# Altium schematic sheet NFC_READER.SchDoc
size 330 x 220 mm; SheetNumber: 1; SheetTotal: 1
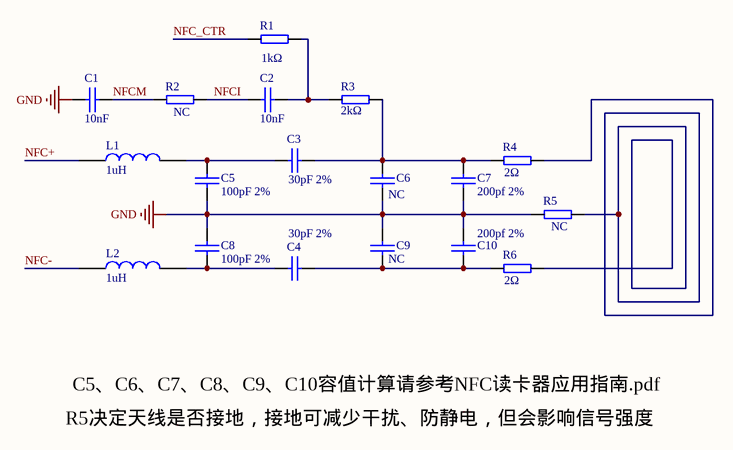
[diagram p0: NFC_READER.SchDoc]

## Parts
C1  10nF  [0402_C]
C2  10nF  [0402_C]
C3  30pF 2%  [0402_C]
C4  30pF 2%  [0402_C]
C5  100pF 2%  [0402_C]
C6  NC  [0402_C]
C7  200pf 2%  [0402_C]
C8  100pF 2%  [0402_C]
C9  NC  [0402_C]
C10  200pf 2%  [0402_C]
L1  1uH  [0603]
L2  1uH  [0603]
R1  1kΩ  [0402]
R2  NC  [0402]
R3  2kΩ  [0402]
R4  2Ω  [0402]
R5  NC  [0402]
R6  2Ω  [0402]

## Nets
GND: C1.2 C5.1 C6.1 C7.1 C8.2 C9.2 C10.2 R5.2
NFC+: L1.1
NFC-: L2.1
NFC_CTR: R1.2
NFCI: C2.1 R2.1
NFCM: C1.1 R2.2
NetC2_2: C2.2 R1.1 R3.2
NetC3_1: C3.1 C5.2 L1.2
NetC3_2: C3.2 C6.2 C7.2 R3.1 R4.1
NetC4_1: C4.1 C8.1 L2.2
NetC4_2: C4.2 C9.1 C10.1 R6.1
NetR4_2: R4.2 R5.1 R6.2

## Notes on the sheet
- R5决定天线是否接地，接地可减少干扰、防静电，但会影响信号强度
- C5、C6、C7、C8、C9、C10容值计算请参考NFC读卡器应用指南.pdf

## Library data of the parts
C1-C10 = CAP: Capacitor
L1 L2 = INDUCTOR
R1-R6 = RES